# Altium schematic sheet PCB-PWR_04_AUX_HARNESS.SchDoc
size 420 x 297 mm
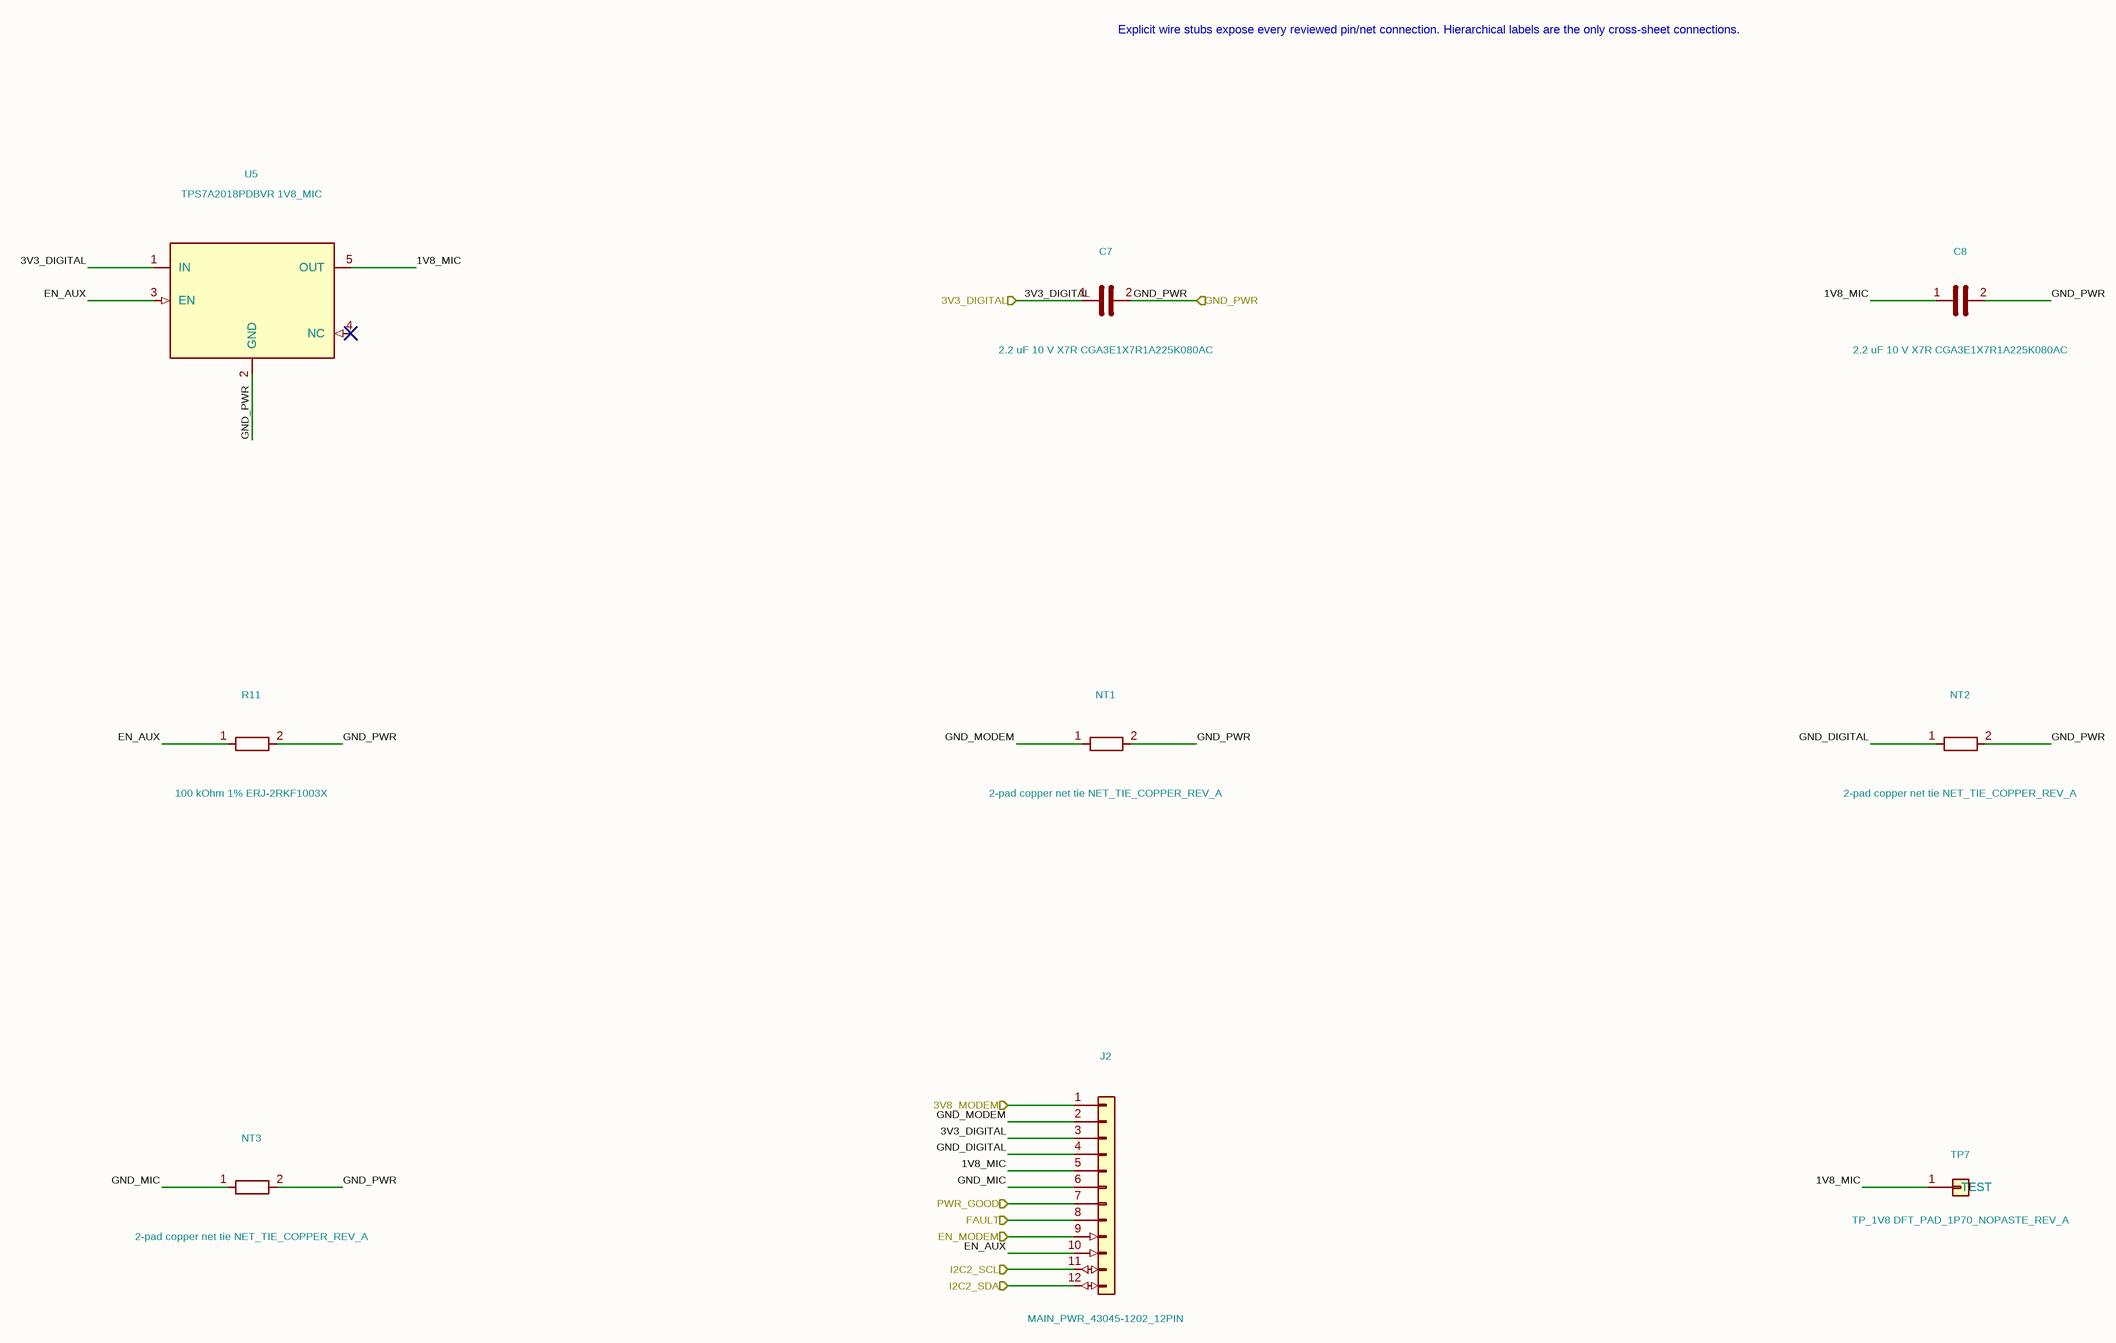
[diagram p0: PCB-PWR_04_AUX_HARNESS.SchDoc]

## Parts
C7  2.2 uF 10 V X7R CGA3E1X7R1A225K080AC  [C_0603_1608Metric]
C8  2.2 uF 10 V X7R CGA3E1X7R1A225K080AC  [C_0603_1608Metric]
J2  MAIN_PWR_43045-1202_12PIN  [Molex_43045-1202_MicroFit-12_RA]
NT1  2-pad copper net tie NET_TIE_COPPER_REV_A  [NetTie-2_SMD_Pad0.5mm]
NT2  2-pad copper net tie NET_TIE_COPPER_REV_A  [NetTie-2_SMD_Pad0.5mm]
NT3  2-pad copper net tie NET_TIE_COPPER_REV_A  [NetTie-2_SMD_Pad0.5mm]
R11  100 kOhm 1% ERJ-2RKF1003X  [R_0402_1005Metric]
TP7  TP_1V8 DFT_PAD_1P70_NOPASTE_REV_A  [TestPoint_DFT_1.7mm_NoPaste]
U5  TPS7A2018PDBVR 1V8_MIC  [TI_DBV0005A_SOT23-5]

## Ports
3V3_DIGITAL, 3V8_MODEM, EN_MODEM, FAULT, GND_PWR, I2C2_SCL, I2C2_SDA, PWR_GOOD

## Nets
1V8_MIC: C8.1 J2.5(1V8_MIC) TP7.1(TEST) U5.5(OUT)
3V3_DIGITAL: C7.1 J2.3(3V3_DIGITAL) U5.1(IN) ; port 3V3_DIGITAL
3V8_MODEM: J2.1(3V8_MODEM) ; port 3V8_MODEM
EN_AUX: J2.10(EN_AUX) R11.1 U5.3(EN)
EN_MODEM: J2.9(EN_MODEM) ; port EN_MODEM
FAULT: J2.8(FAULT) ; port FAULT
GND_DIGITAL: J2.4(GND_DIGITAL) NT2.1
GND_MIC: J2.6(GND_MIC) NT3.1
GND_MODEM: J2.2(GND_MODEM) NT1.1
GND_PWR: C7.2 C8.2 NT1.2 NT2.2 NT3.2 R11.2 U5.2(GND) ; port GND_PWR
I2C2_SCL: J2.11(I2C2_SCL) ; port I2C2_SCL
I2C2_SDA: J2.12(I2C2_SDA) ; port I2C2_SDA
PWR_GOOD: J2.7(PWR_GOOD) ; port PWR_GOOD

Not connected (* = marked no-connect by the designer): U5 4(NC)*

## Notes on the sheet
- Explicit wire stubs expose every reviewed pin/net connection. Hierarchical labels are the only cross-sheet connections.
- 1
- 2
- 3
- 4
- 5
- 6
- 7
- 8
- A
- B
- C
- D
- E
- Human-readable hierarchy; exact pin/net equivalence enforced
- Functional sheet 5 of 5
- NOT FOR MANUFACTURE - routing/DRC/DFM/Review B pending
- Title: 1V8 + MAIN harness
- File: PCB-PWR_04_AUX_HARNESS.kicad_sch
- Sheet: /
- Dioneya / ZS-BPLA
- F
- KiCad E.D.A.  kicad (5.1.4)-1
- Size: A3
- Date: 2026-09-17
- Rev: A
- Id: 1/1

## Library data of the parts
C7 C8 = C: Value: 2.2 uF 10 V X7R CGA3E1X7R1A225K080AC; Footprint: Capacitor_SMD:C_0603_1608Metric
J2 = Conn_01x12: Value: MAIN_PWR_43045-1202_12PIN; Footprint: DioneyaMain:Molex_43045-1202_MicroFit-12_RA
NT1-NT3 R11 = R
  NT1-NT3: Value: 2-pad copper net tie NET_TIE_COPPER_REV_A; Footprint: NetTie:NetTie-2_SMD_Pad0.5mm
  R11: Value: 100 kOhm 1% ERJ-2RKF1003X; Footprint: Resistor_SMD:R_0402_1005Metric
TP7 = TESTPOINT: Value: TP_1V8 DFT_PAD_1P70_NOPASTE_REV_A; Footprint: DioneyaPWR:TestPoint_DFT_1.7mm_NoPaste
U5 = Conn_01x05: Value: TPS7A2018PDBVR 1V8_MIC; Footprint: DioneyaMain:TI_DBV0005A_SOT23-5